# Altium schematic sheet Top_Sheet.SchDoc
size A4; SheetNumber: 1; SheetTotal: 3
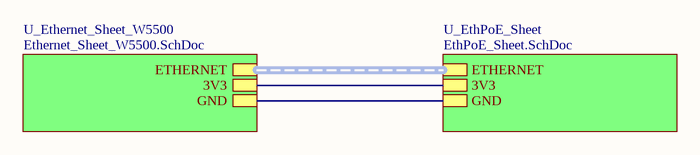
[diagram p0: Top_Sheet.SchDoc]

## Sub-sheets
U_Ethernet_Sheet_W5500 = Ethernet_Sheet_W5500.SchDoc: ETHERNET (harness ETHERNET), 3V3, GND
U_EthPoE_Sheet = EthPoE_Sheet.SchDoc: ETHERNET (harness ETHERNET), 3V3, GND

## Nets
(unnamed): sheet U_EthPoE_Sheet/3V3, sheet U_Ethernet_Sheet_W5500/3V3
(unnamed): sheet U_EthPoE_Sheet/GND, sheet U_Ethernet_Sheet_W5500/GND

## Buses and harness runs
harness sheet U_Ethernet_Sheet_W5500/ETHERNET = sheet U_EthPoE_Sheet/ETHERNET